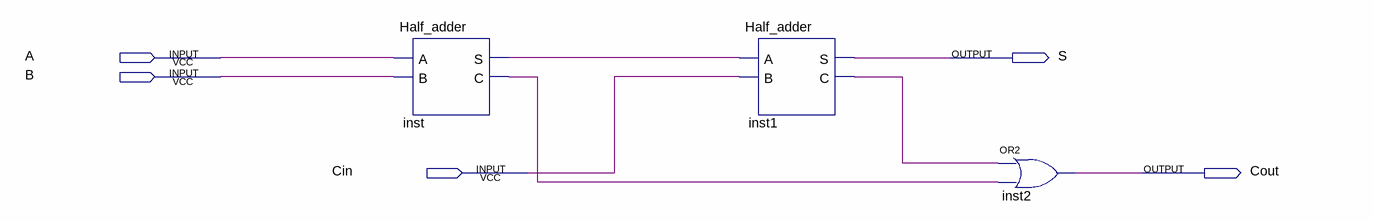
[diagram p0: schematic sheet]
// Quartus schematic Full_adder.bdf as structural Verilog: 3 symbols, 5 pins
module Full_adder (
  input  A,
  input  B,
  input  Cin,
  output S,
  output Cout
);

  wire inst1_c, inst_c, inst_s;

  Half_adder inst (.A(A), .B(B), .S(inst_s), .C(inst_c));
  Half_adder inst1 (.A(inst_s), .B(Cin), .S(S), .C(inst1_c));
  or inst2 (Cout, inst1_c, inst_c);
endmodule
